# EasyEDA Pro project SciOly_EV_Controller_and_Encoder.epro, schematic Schematic2
Board Name: Board2; Create Date: 2026-11-21; Page Name: P1; Project Name: SciOly EV Controller; Schematic Name: Schematic2; Update Date: 2026-11-21; Company: EasyEDA.com; Page Size: A4; Version: v1
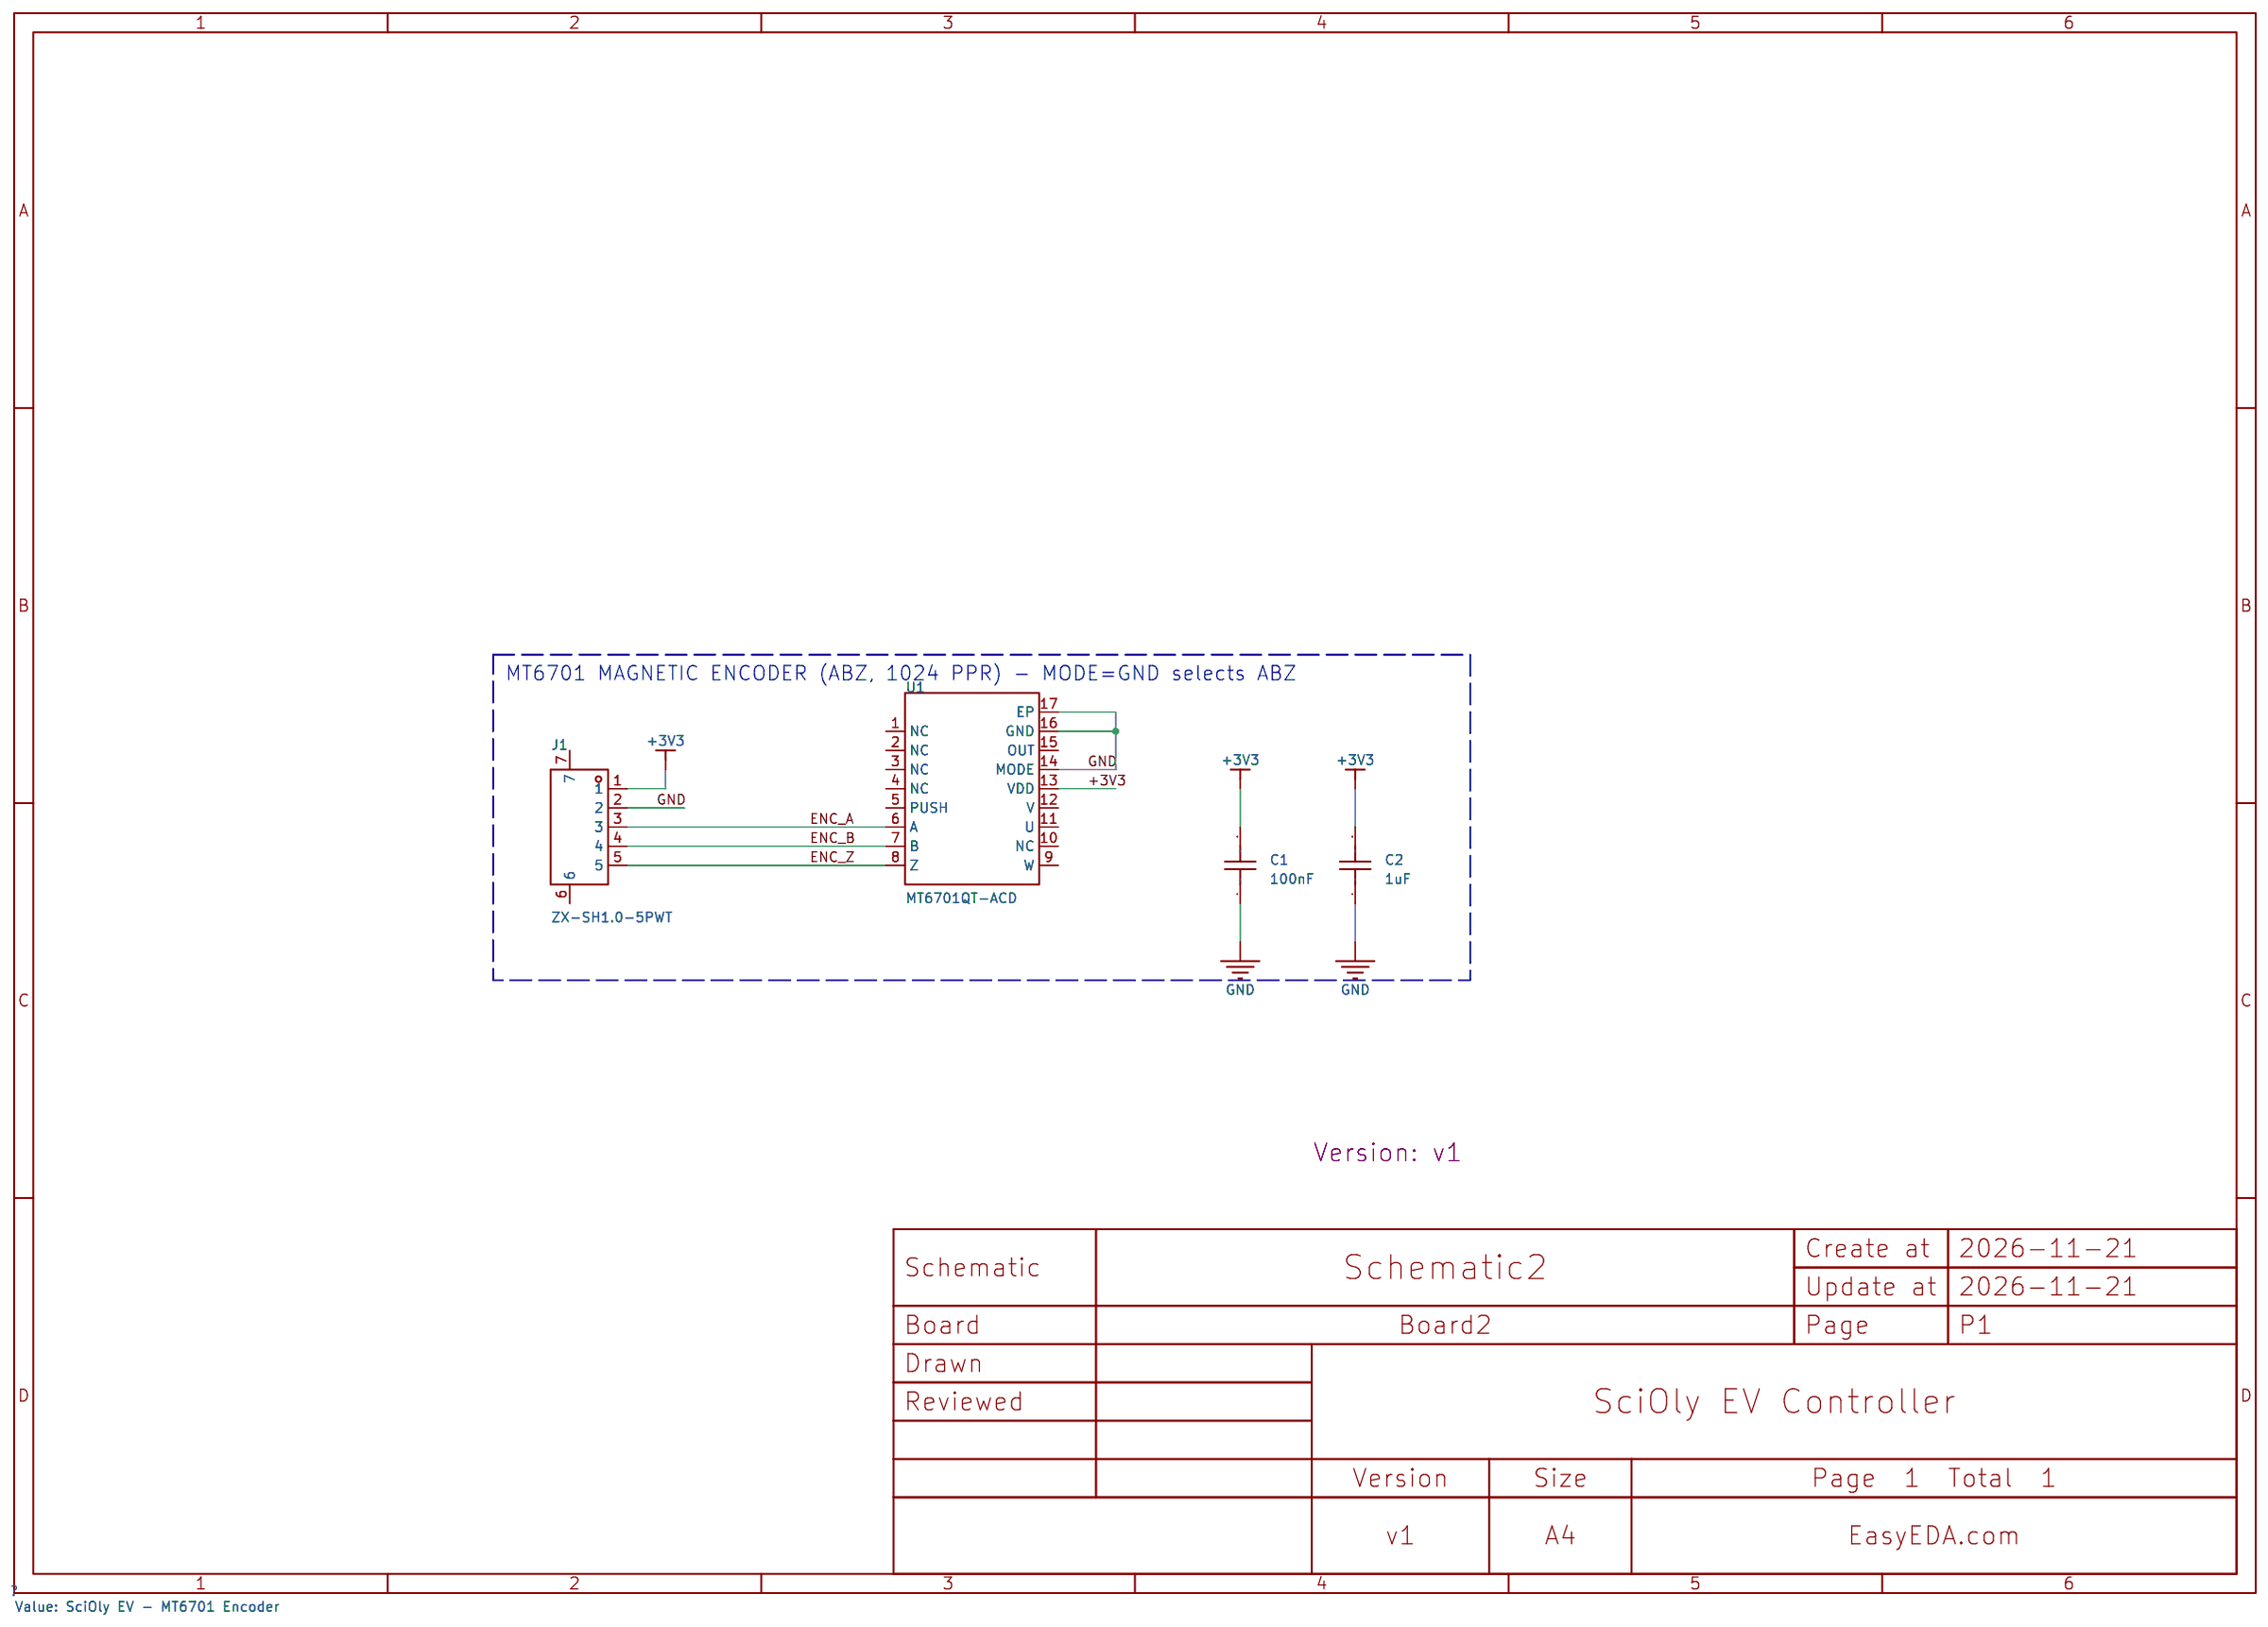
[diagram p0: schematic sheet]

## Parts
C1  100nF  [C0402]
C2  1uF  [C0402]
J1  ZX-SH1.0-5PWT  [CONN-SMD_5P-P1.00_MEGASTAR_ZX-SH1.0-5PWT]
U1  MT6701QT-ACD  [VQFN-16_L3.0-W3.0-P0.50-TL-EP1.7]

## Library data of the parts
C1 = CL05B104KO5NNNC: Capacitance:100nF Tolerance:±10% Tolerance:±10% Voltage Rating:16V Temperature Coefficient:X7R; LCSC Part Name: 100nF ±10% 16V; Supplier Part: C1525; Manufacturer: SAMSUNG(三星); Supplier Footprint: 0402; JLCPCB Part Class: Basic Part; Datasheet: https://item.szlcsc.com/datasheet/CL05B104KO5NNNC/1877.html; Supplier: LCSC; Tolerance: ±10%; Voltage Rating: 16V; Temperature Coefficient: X7R
C2 = CL05A105KA5NQNC: Capacitance:1uF Tolerance:±10% Tolerance:±10% Voltage Rating:25V Temperature Coefficient:X5R; LCSC Part Name: 1uF ±10% 25V; Supplier Part: C52923; Manufacturer: SAMSUNG(三星); Supplier Footprint: 0402; JLCPCB Part Class: Basic Part; Datasheet: https://item.szlcsc.com/datasheet/CL05A105KA5NQNC/53938.html; Supplier: LCSC; Tolerance: ±10%; Voltage Rating: 25V; Temperature Coefficient: X5R
J1 = ZX-SH1.0-5PWT: Pins Structure:1x5P Pitch:1mm Mounting Type:Surface Mount, Right Angle Reference Series:SH Number of Pins:5P Number of Rows:1 Number of PINs Per Row:5 Row Spacing:- Current Rating:1A Contact Material:Brass Contact Plating:Tin Operating Temperature:-40℃~+8; LCSC Part Name: 1x5P 间距:1mm 卧贴 系列:SH; Supplier Part: C7430447; Manufacturer: Megastar(兆星); Supplier Footprint: SMD,P=1mm,卧贴; JLCPCB Part Class: Extended Part; Datasheet: https://item.szlcsc.com/datasheet/ZX-SH1.0-5PWT/8430316.html; Supplier: LCSC; Pins Structure: 1x5P; Pitch: 1mm; Mounting Type: Surface Mount, Right Angle; Reference Series: SH; Number of Pins: 5P; Number of Rows: 1; Number of PINs Per Row: 5; Current Rating: 1A; Contact Material: Brass; Contact Plating: Tin; Operating Temperature: -40℃~+85℃; Voltage Rating: 50V; Plastic Material: LCP; Supplementary Features: Auxiliary Solder Pin; Color: Beige; Z-Height of the Board: 3.15mm; X-Length of Bottom Edge on Board (Spacing Line): 7.35mm; Y-Width of Bottom Edge on Board: 4.3mm
U1 = MT6701QT-ACD_C49257133: Out Type:ABZ；SSI；PWM Resolution:12bit Rotate Speed:55000rpm Number of Conjugate Points of UVW:16 Supply Voltage:3.3V~5V Supply Voltage:3.3V~5V Supply Current:10mA Operating Temperature:-40℃~+125℃ Operating Temperature:-40℃~+125℃ Features:Incremental encod; LCSC Part Name: 磁性编码器IC; Supplier Part: C49257133; Manufacturer: NOVOSENSE(纳芯微); Supplier Footprint: QFN-16(3x3); JLCPCB Part Class: Extended Part; Datasheet: https://item.szlcsc.com/datasheet/MT6701QT-ACD/51694212.html; Supplier: LCSC; Out Type: ABZ；SSI；PWM; Resolution: 12bit; Rotate Speed: 55000rpm; Number of Conjugate Points of UVW: 16; Supply Voltage: 3.3V~5V; Supply Current: 10mA; Operating Temperature: -40℃~+125℃; Features: Incremental encoder output；Programmable hysteresis；Magnetic field too high/low warning

## Nets
+3V3: C1.2 C2.2 J1.1 U1.13(VDD)
GND: C1.1 C2.1 J1.2 U1.14(MODE) U1.16(GND) U1.17(EP)
ENC_A: J1.3 U1.6(A)
ENC_B: J1.4 U1.7(B)
ENC_Z: J1.5 U1.8(Z)

Not connected (* = marked no-connect by the designer): J1 6 7; U1 1(NC) 2(NC) 3(NC) 4(NC) 5(PUSH) 9(W) 10(NC) 11(U) 12(V) 15(OUT)

## Notes on the sheet
- MT6701 MAGNETIC ENCODER (ABZ, 1024 PPR) - MODE=GND selects ABZ
